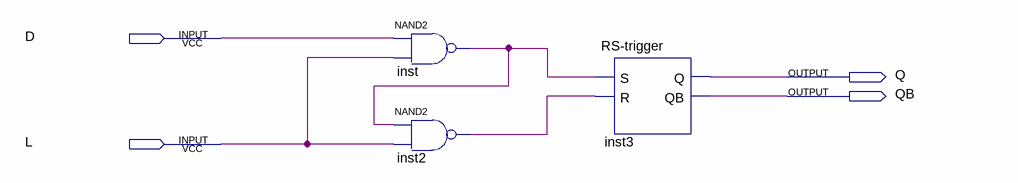
[diagram p0: schematic sheet]
// Quartus schematic D.bdf as structural Verilog: 3 symbols, 4 pins
module D (
  input  D,
  input  L,
  output Q,
  output QB
);

  wire inst2_out, inst_out;

  nand inst (inst_out, D, L);
  nand inst2 (inst2_out, inst_out, L);
  \RS-trigger  inst3 (.S(inst_out), .R(inst2_out), .Q(Q), .QB(QB));
endmodule
